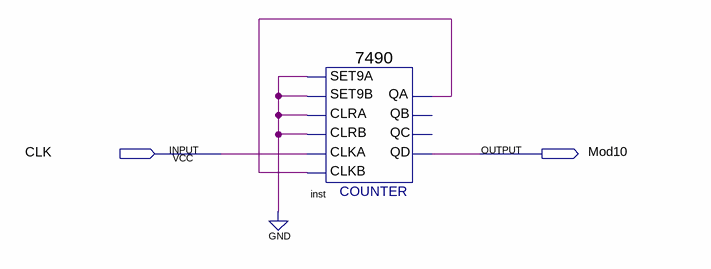
[diagram p0: schematic sheet]
// Quartus schematic FPGA_Mod10.bdf as structural Verilog: 1 symbols, 2 pins
module FPGA_Mod10 (
  input  CLK,
  output Mod10
);

  wire inst_qa;

  \7490  inst (
    .SET9A(1'b0), .CLRA(1'b0), .SET9B(1'b0), .CLKB(inst_qa), .CLKA(CLK), .CLRB(1'b0), .QD(Mod10), .QA(inst_qa));  // open: QB, QC
endmodule
